# Altium schematic sheet Whisper_MCU.SchDoc
size A4; SheetNumber: 3; SheetTotal: 4
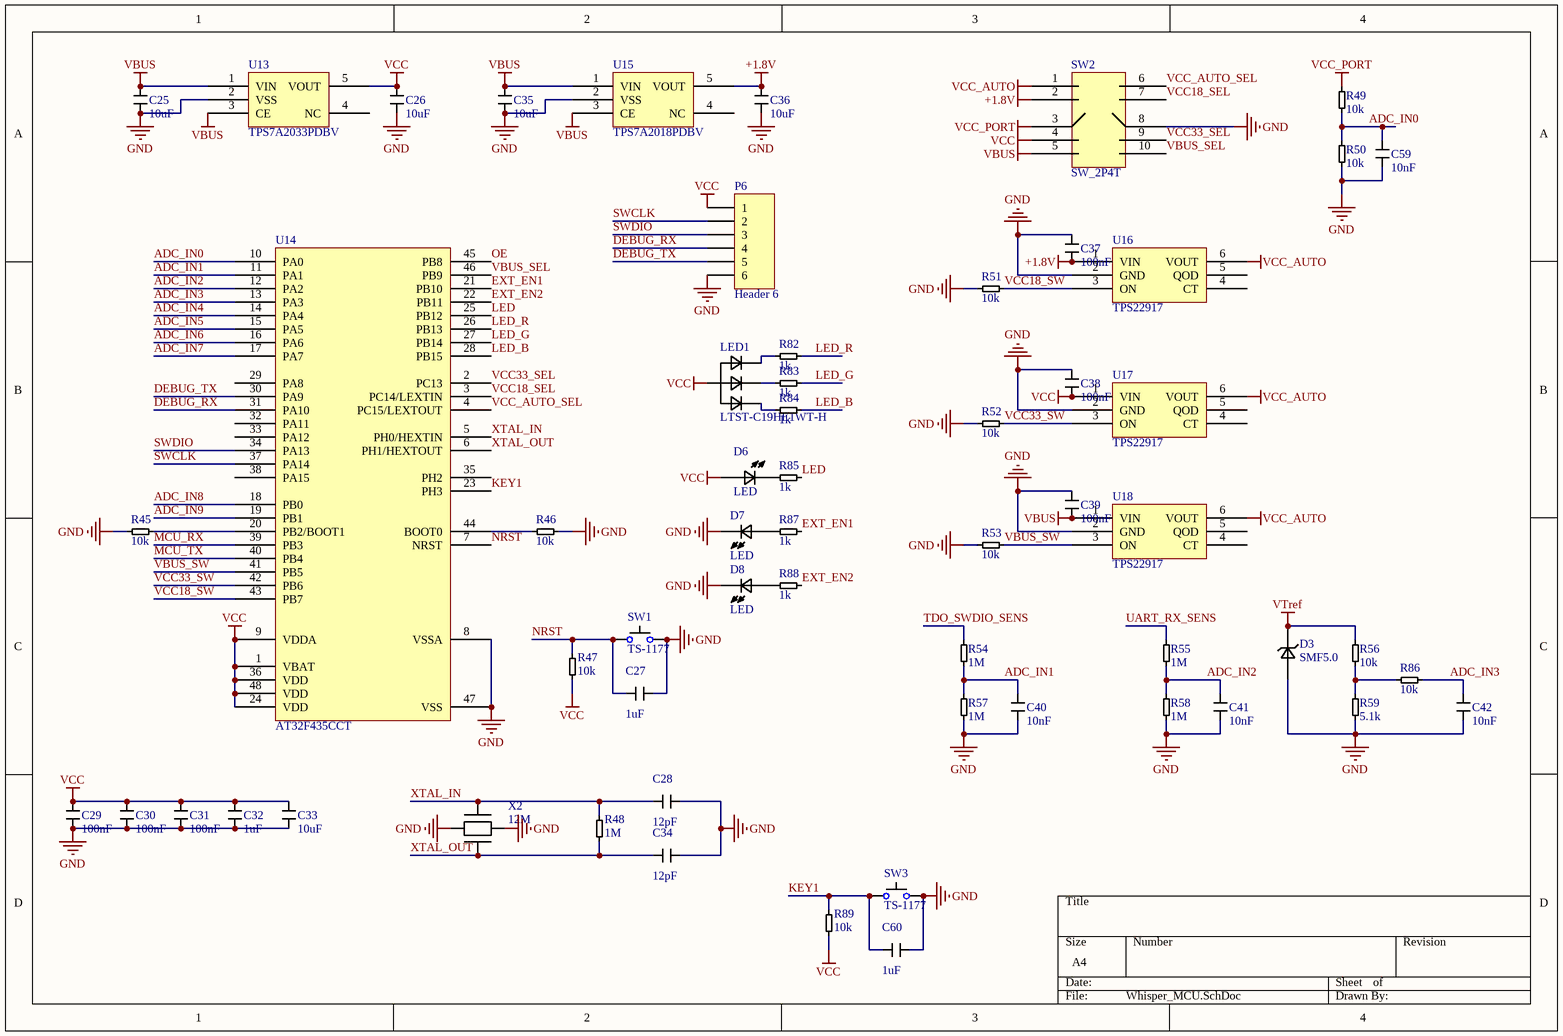
[diagram p0: Whisper_MCU.SchDoc]

## Parts
C25  10uF  [0603-Cap]
C26  10uF  [0603-Cap]
C27  1uF  [0603-Cap]
C28  12pF  [0603-Cap]
C29  100nF  [0603-Cap]
C30  100nF  [0603-Cap]
C31  100nF  [0603-Cap]
C32  1uF  [0603-Cap]
C33  10uF  [0603-Cap]
C34  12pF  [0603-Cap]
C35  10uF  [0603-Cap]
C36  10uF  [0603-Cap]
C37  100nF  [0603-Cap]
C38  100nF  [0603-Cap]
C39  100nF  [0603-Cap]
C40  10nF  [0603-Cap]
C41  10nF  [0603-Cap]
C42  10nF  [0603-Cap]
C59  10nF  [0603-Cap]
C60  1uF  [0603-Cap]
D3  SMF5.0  [SOD-123]
D6  LED  [0603-1]
D7  LED  [0603-1]
D8  LED  [0603-1]
LED1  LTST-C19HE1WT-H  [RGB1.6*1.6]
P6  Header 6  [HDR1X6]
R45  10k  [0603]
R46  10k  [0603]
R47  10k  [0603]
R48  1M  [0603]
R49  10k  [0603]
R50  10k  [0603]
R51  10k  [0603]
R52  10k  [0603]
R53  10k  [0603]
R54  1M  [0603]
R55  1M  [0603]
R56  10k  [0603]
R57  1M  [0603]
R58  1M  [0603]
R59  5.1k  [0603]
R82  1k  [0603]
R83  1k  [0603]
R84  1k  [0603]
R85  1k  [0603]
R86  10k  [0603]
R87  1k  [0603]
R88  1k  [0603]
R89  10k  [0603]
SW1  TS-1177  [BTN3*3]
SW2  SW_2P4T  [SW-SS-3456S-02-L1]
SW3  TS-1177  [BTN3*3]
U13  TPS7A2033PDBV  [SOT23-5]
U14  AT32F435CCT  [LQFP-48]
U15  TPS7A2018PDBV  [SOT23-5]
U16  TPS22917  [SOT236]
U17  TPS22917  [SOT236]
U18  TPS22917  [SOT236]
X2  12M  [XTAL-3225-4P]

## Nets
+1.8V: C36.2 C37.1 SW2.2 U15.5(VOUT) U16.1(VIN)
GND: C25.1 C26.1 C27.1 C28.1 C29.1 C30.1 C31.1 C32.1 C33.1 C34.1 C35.1 C36.1 C37.2 C38.2 C39.2 C40.2 C41.2 C42.2 C59.2 C60.1 D3.1 D7.2 D8.2 P6.6 R45.2 R46.2 R50.1 R51.2 R52.2 R53.2 R57.1 R58.1 R59.1 SW1.2 SW2.8 SW3.2 U13.2(VSS) U14.8(VSSA) U14.47(VSS) U15.2(VSS) U16.2(GND) U17.2(GND) U18.2(GND) X2.2 X2.4
VBUS: C25.2 C35.2 C39.1 SW2.5 U13.1(VIN) U13.3(CE) U15.1(VIN) U15.3(CE) U18.1(VIN)
VCC: C26.2 C29.2 C30.2 C31.2 C32.2 C33.2 C38.1 D6.1 LED1.4 P6.1 R47.1 R89.1 SW2.4 U13.5(VOUT) U14.1(VBAT) U14.9(VDDA) U14.24(VDD) U14.36(VDD) U14.48(VDD) U17.1(VIN)
VCC_AUTO: SW2.1 U16.6(VOUT) U17.6(VOUT) U18.6(VOUT)
VCC_PORT: R49.2 SW2.3
VTref: D3.2 R56.2
ADC_IN0: C59.1 R49.1 R50.2 U14.10(PA0)
ADC_IN1: C40.1 R54.1 R57.2 U14.11(PA1)
ADC_IN2: C41.1 R55.1 R58.2 U14.12(PA2)
ADC_IN3: C42.1 R86.1 U14.13(PA3)
ADC_IN4: U14.14(PA4)
ADC_IN5: U14.15(PA5)
ADC_IN6: U14.16(PA6)
ADC_IN7: U14.17(PA7)
ADC_IN8: U14.18(PB0)
ADC_IN9: U14.19(PB1)
DEBUG_RX: P6.4 U14.31(PA10)
DEBUG_TX: P6.5 U14.30(PA9)
EXT_EN1: R87.2 U14.21(PB10)
EXT_EN2: R88.2 U14.22(PB11)
KEY1: C60.2 R89.2 SW3.1 U14.23(PH3)
LED: R85.2 U14.25(PB12)
LED_B: R84.2 U14.28(PB15)
LED_G: R83.2 U14.27(PB14)
LED_R: R82.2 U14.26(PB13)
MCU_RX: U14.39(PB3)
MCU_TX: U14.40(PB4)
NRST: C27.2 R47.2 SW1.1 U14.7(NRST)
OE: U14.45(PB8)
SWCLK: P6.2 U14.37(PA14)
SWDIO: P6.3 U14.34(PA13)
TDO_SWDIO_SENS: R54.2
UART_RX_SENS: R55.2
VBUS_SEL: SW2.10 U14.46(PB9)
VBUS_SW: R53.1 U14.41(PB5) U18.3(ON)
VCC18_SEL: SW2.7 U14.3(PC14/LEXTIN)
VCC18_SW: R51.1 U14.43(PB7) U16.3(ON)
VCC33_SEL: SW2.9 U14.2(PC13)
VCC33_SW: R52.1 U14.42(PB6) U17.3(ON)
VCC_AUTO_SEL: SW2.6 U14.4(PC15/LEXTOUT)
XTAL_IN: C28.2 R48.2 U14.5(PH0/HEXTIN) X2.3
XTAL_OUT: C34.2 R48.1 U14.6(PH1/HEXTOUT) X2.1
NetD6_2: D6.2 R85.1
NetD7_1: D7.1 R87.1
NetD8_1: D8.1 R88.1
NetLED1_1: LED1.1 R82.1
NetLED1_2: LED1.2 R83.1
NetLED1_3: LED1.3 R84.1
NetR45_1: R45.1 U14.20(PB2/BOOT1)
NetR46_1: R46.1 U14.44(BOOT0)
NetR56_1: R56.1 R59.2 R86.2

Not connected (* = marked no-connect by the designer): U13 4(NC); U14 29(PA8) 32(PA11) 33(PA12) 35(PH2) 38(PA15); U15 4(NC); U16 4(CT) 5(QOD); U17 4(CT) 5(QOD); U18 4(CT) 5(QOD)

## Library data of the parts
C25 C26 C35 C36 = Cap: CL10A475KA8NQNC
C27-C34 C37-C42 C59 C60 = Cap
D3 = TVS
LED1 = RGB_CA: C427425
P6 = Header 6: Header, 6-Pin; LatestRevisionDate: 17-Jul-2002; LatestRevisionNote: Re-released for DXP Platform.; Publisher: Altium Limited
R45-R59 R82-R89 = Res
SW1 SW3 = Btn: C561512
U13 U15 = ME6211
U14 = AT32F435CxT
X2 = XTAL-4LEAD